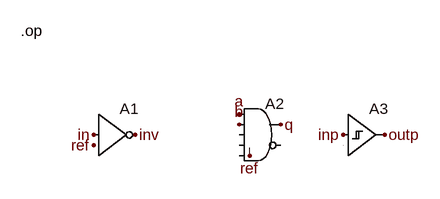
[diagram p0: schematic logic.asc]
logic.asc, the LTspice schematic file:
Version 4
SHEET 1 800 600
FLAG 128 192 in
FLAG 192 192 inv
FLAG 128 208 ref
SYMBOL Digital\\inv 128 128 R0
SYMATTR InstName A1
FLAG 352 160 a
FLAG 352 176 b
FLAG 416 176 q
FLAG 368 224 ref
SYMBOL Digital\\and 384 128 R0
SYMATTR InstName A2
FLAG 512 192 inp
FLAG 576 192 outp
SYMBOL Digital\\schmtbuf 512 128 R0
SYMATTR InstName A3
TEXT 16 32 Left 2 !.op

The netlist it stands for:
* logic.asc
A1 in ref ref ref ref inv ref ref BUF
A2 a b ref ref ref ref q ref AND
A3 inp 0 0 0 0 0 outp 0 SCHMITT
.op
.backanno
.end